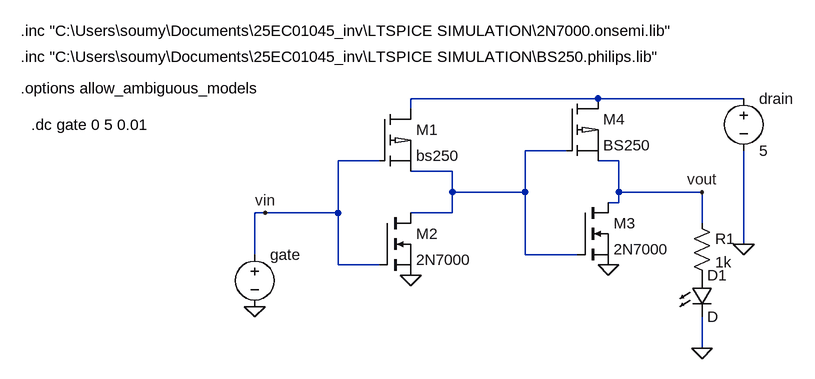
[diagram p0: schematic extra_question_ltspice.asc]
extra_question_ltspice.asc, the LTspice schematic file:
Version 4.1
SHEET 1 880 680
WIRE 384 48 96 48
WIRE 608 48 384 48
WIRE 96 64 96 48
WIRE 336 128 272 128
WIRE 48 144 -16 144
WIRE 416 144 384 144
WIRE 160 160 96 160
WIRE 160 192 160 160
WIRE 272 192 272 128
WIRE 272 192 160 192
WIRE 416 192 416 144
WIRE 544 192 416 192
WIRE 416 208 416 192
WIRE 416 208 400 208
WIRE -128 224 -144 224
WIRE -16 224 -16 144
WIRE -16 224 -128 224
WIRE 160 224 160 192
WIRE 160 224 96 224
WIRE 544 240 544 192
WIRE 608 272 608 128
WIRE -144 288 -144 224
WIRE 272 288 272 192
WIRE 352 288 272 288
WIRE -16 304 -16 224
WIRE 48 304 -16 304
WIRE 544 432 544 384
FLAG -144 368 0
FLAG 96 320 0
FLAG 400 304 0
FLAG 608 272 0
FLAG 544 432 0
FLAG -128 224 vin
FLAG 544 192 vout
SYMBOL pmos 48 64 R0
SYMATTR InstName M1
SYMATTR Value bs250
SYMATTR Prefix X
SYMBOL nmos 48 224 R0
SYMATTR InstName M2
SYMATTR Value 2N7000
SYMATTR Prefix X
SYMBOL nmos 352 208 R0
SYMATTR InstName M3
SYMATTR Value 2N7000
SYMATTR Prefix X
SYMBOL pmos 336 48 R0
SYMATTR InstName M4
SYMATTR Value BS250
SYMATTR Prefix X
SYMBOL voltage -144 272 R0
WINDOW 123 0 0 Left 0
WINDOW 39 0 0 Left 0
SYMATTR InstName gate
SYMATTR Value ""
SYMBOL voltage 608 32 R0
WINDOW 123 0 0 Left 0
WINDOW 39 0 0 Left 0
SYMATTR InstName drain
SYMATTR Value 5
SYMBOL LED 528 320 R0
SYMATTR InstName D1
SYMBOL res 528 224 R0
SYMATTR InstName R1
SYMATTR Value 1k
TEXT -504 -56 Left 2 !.inc "C:\\Users\\soumy\\Documents\\25EC01045_inv\\LTSPICE SIMULATION\\2N7000.onsemi.lib"
TEXT -504 -16 Left 2 !.inc "C:\\Users\\soumy\\Documents\\25EC01045_inv\\LTSPICE SIMULATION\\BS250.philips.lib"
TEXT -504 32 Left 2 !.options allow_ambiguous_models
TEXT -488 88 Left 2 !.dc gate 0 5 0.01

The netlist it stands for:
* extra_question_ltspice.asc
X§M1 N002 vin N001 bs250  ; pins D G S
X§M2 N002 vin 0 2N7000  ; pins D G S
X§M3 vout N002 0 2N7000  ; pins D G S
X§M4 vout N002 N001 BS250  ; pins D G S
V§gate vin 0
V§drain N001 0 5
D1 P001 0 D
R1 vout P001 1k
.model D D
.lib standard.dio
.inc "C:\Users\soumy\Documents\25EC01045_inv\LTSPICE SIMULATION\2N7000.onsemi.lib"
.inc "C:\Users\soumy\Documents\25EC01045_inv\LTSPICE SIMULATION\BS250.philips.lib"
.options allow_ambiguous_models
.dc gate 0 5 0.01
.backanno
.end

* Results of the author's LTspice run, read from the files saved beside the schematic
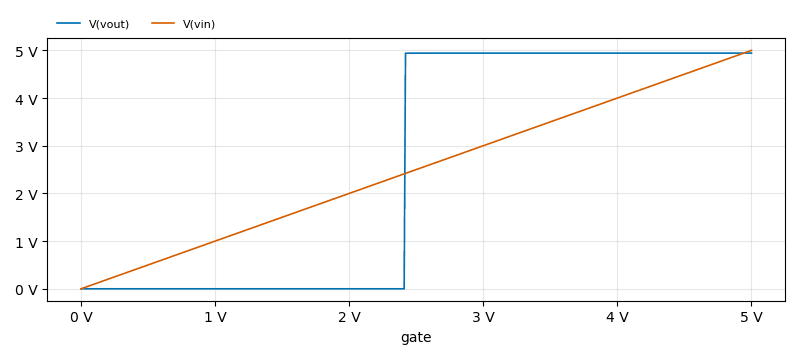
[diagram p1: DC transfer characteristic of extra_question_ltspice.asc, plotted from the saved traces]
* DC transfer characteristic, 1 run:
*   V(vout): 114 pV at gate=0 V, 4.942 V at gate=5 V, min 114 pV, max 4.942 V
*   V(vin): 0 V at gate=0 V, 5 V at gate=5 V, min 0 V, max 5 V